# Altium schematic sheet BOARD_ADS.SchDoc
size A3; SheetNumber: 1; SheetTotal: 1
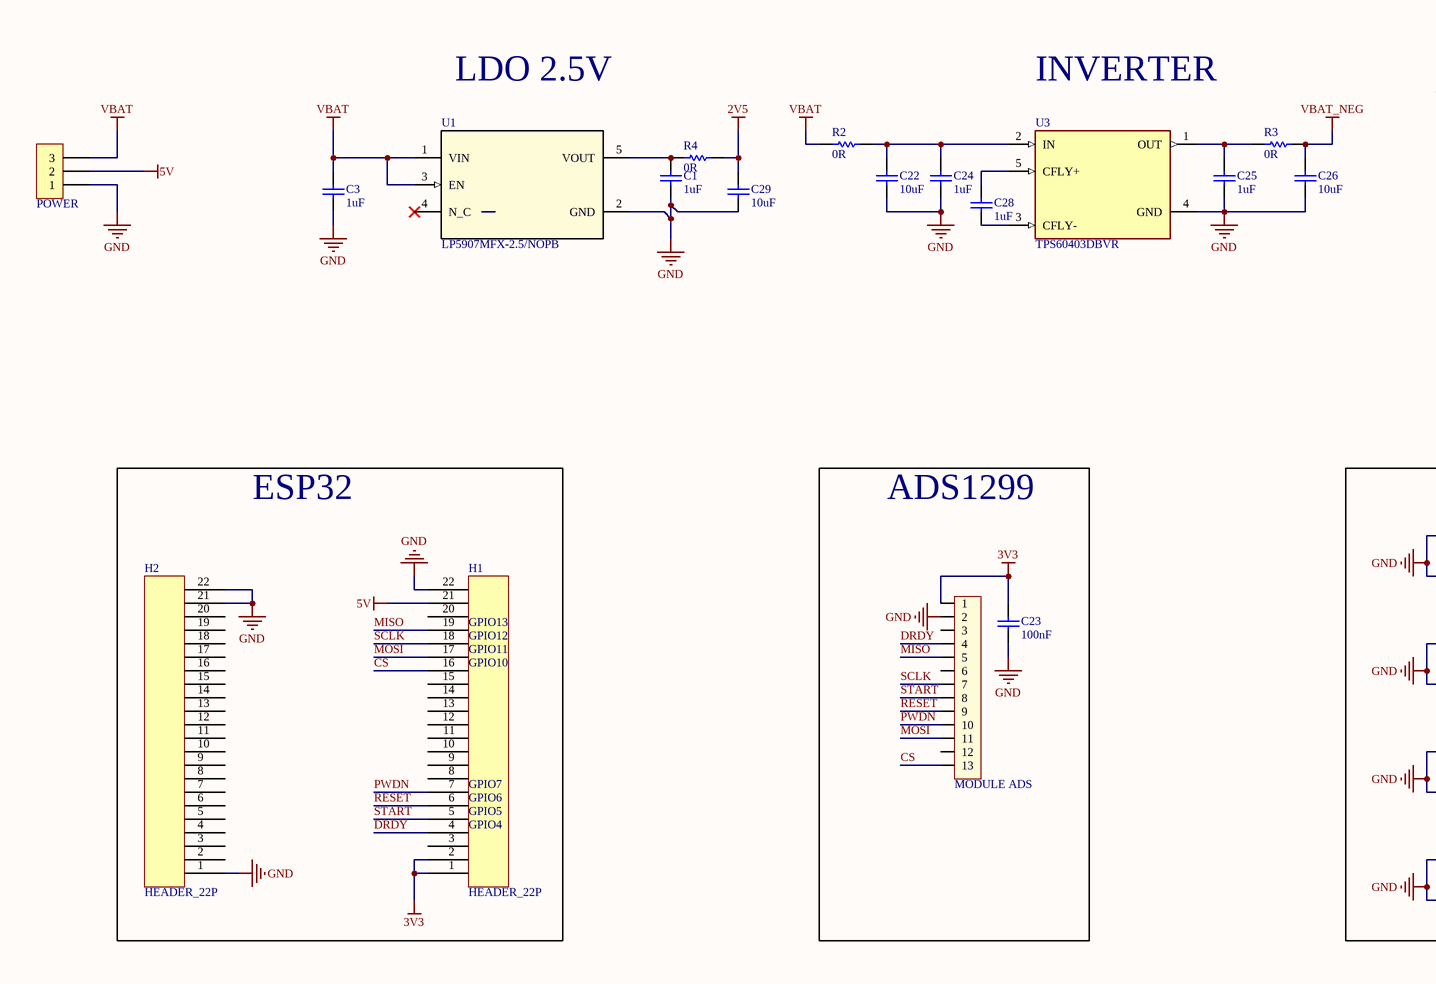
[diagram p0: BOARD_ADS.SchDoc, left]
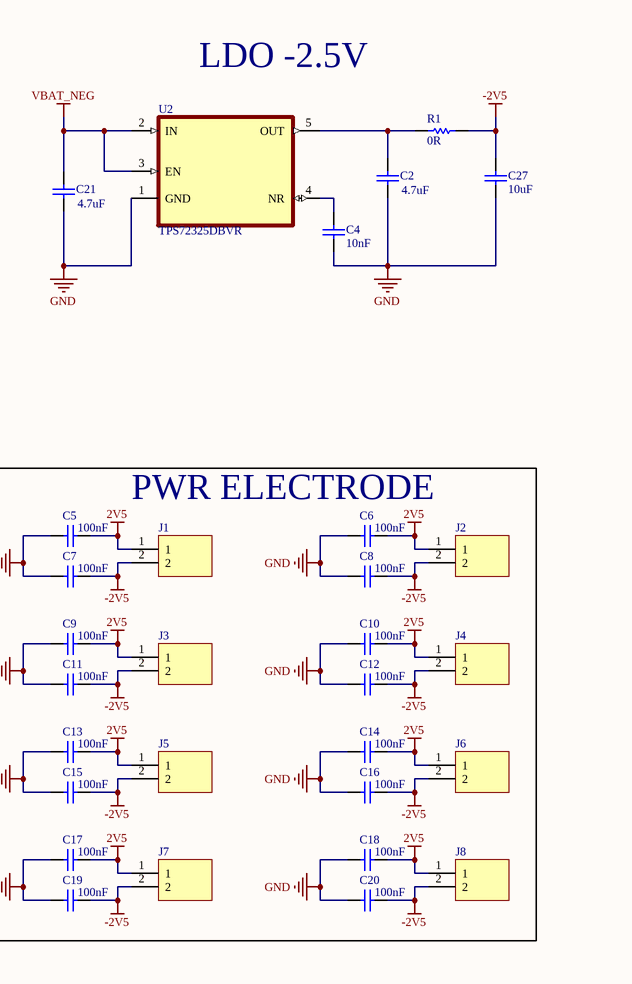
[diagram p1: BOARD_ADS.SchDoc, middle]

## Parts
C1  1uF  [C0805L]
C2  4.7uF  [C0805L]
C3  1uF  [C0805L]
C4  10nF  [C0805L]
C5  100nF  [C0805L]
C6  100nF  [C0805L]
C7  100nF  [C0805L]
C8  100nF  [C0805L]
C9  100nF  [C0805L]
C10  100nF  [C0805L]
C11  100nF  [C0805L]
C12  100nF  [C0805L]
C13  100nF  [C0805L]
C14  100nF  [C0805L]
C15  100nF  [C0805L]
C16  100nF  [C0805L]
C17  100nF  [C0805L]
C18  100nF  [C0805L]
C19  100nF  [C0805L]
C20  100nF  [C0805L]
C21  4.7uF  [C0805L]
C22  10uF  [C0805L]
C23  100nF  [C0805L]
C24  1uF  [C0805L]
C25  1uF  [C0805L]
C26  10uF  [C0805L]
C27  10uF  [C0805L]
C28  1uF  [C0805L]
C29  10uF  [C0805L]
H1  HEADER_22P  [header_22p]
H2  HEADER_22P  [header_22p]
H3  POWER  [XH2.54M-3]
H4  MODULE ADS  [MODULE ADS1299]
J1  (no value)  [HEADER_2P]
J2  (no value)  [HEADER_2P]
J3  (no value)  [HEADER_2P]
J4  (no value)  [HEADER_2P]
J5  (no value)  [HEADER_2P]
J6  (no value)  [HEADER_2P]
J7  (no value)  [HEADER_2P]
J8  (no value)  [HEADER_2P]
R1  0R  [R0805]
R2  0R  [R0805]
R3  0R  [R0805]
R4  0R  [R0805]
U1  LP5907MFX-2.5/NOPB  [DBV0005A_M]
U2  TPS72325DBVR  [SOT95P280X145-5N]
U3  TPS60403DBVR  [SOT95P280X145-5N]

## Blocks framed on the sheet
ESP32: H1 H2
ADS1299: C23 H4
PWR ELECTRODE: C5-C20 J1-J8

## Nets
2V5: C5.2 C6.2 C9.2 C10.2 C13.2 C14.2 C17.2 C18.2 C29.1 J1.1 J2.1 J3.1 J4.1 J5.1 J6.1 J7.1 J8.1 R4.2
3V3: C23.1 H1.1 H1.2 H4.1
5V: H1.21 H3.2
-2V5: C7.2 C8.2 C11.2 C12.2 C15.2 C16.2 C19.2 C20.2 C27.1 J1.2 J2.2 J3.2 J4.2 J5.2 J6.2 J7.2 J8.2 R1.2
GND: C1.2 C2.2 C3.2 C4.2 C5.1 C6.1 C7.1 C8.1 C9.1 C10.1 C11.1 C12.1 C13.1 C14.1 C15.1 C16.1 C17.1 C18.1 C19.1 C20.1 C21.2 C22.2 C23.2 C24.2 C25.2 C26.2 C27.2 C29.2 H1.22 H2.1 H2.21 H2.22 H3.1 H4.2 U1.2(GND) U2.1(GND) U3.4(GND)
VBAT: C3.1 H3.3 R2.1 U1.1(VIN) U1.3(EN)
VBAT_NEG: C21.1 C26.1 R3.2 U2.2(IN) U2.3(EN)
CS: H1.16 H4.13
DRDY: H1.4 H4.4
MISO: H1.19 H4.5
MOSI: H1.17 H4.11
PWDN: H1.7 H4.10
RESET: H1.6 H4.9
SCLK: H1.18 H4.7
START: H1.5 H4.8
NetC1_1: C1.1 R4.1 U1.5(VOUT)
NetC2_1: C2.1 R1.1 U2.5(OUT)
NetC4_1: C4.1 U2.4(NR)
NetC22_1: C22.1 C24.1 R2.2 U3.2(IN)
NetC25_1: C25.1 R3.1 U3.1(OUT)
NetC28_1: C28.1 U3.5(CFLY+)
NetC28_2: C28.2 U3.3(CFLY-)

Not connected (* = marked no-connect by the designer): H1 3 8 9 10 11 12 13 14 15 20; H2 2 3 4 5 6 7 8 9 10 11 12 13 14 15 16 17 18 19 20; H4 3 6 12; U1 4(N_C)*

## Notes on the sheet
- LDO -2.5V
- LDO 2.5V
- INVERTER
- (near H1) GPIO10
- (near H1) GPIO11
- (near H1) GPIO12
- (near H1) GPIO13
- (near H1) GPIO5
- (near H1) GPIO6
- (near H1) GPIO7
- (near H1) GPIO4

## Library data of the parts
C1-C29 = C0805: CAP 0402 MLCC NON-POLARIZED GENERIC; VALUE TOLERANCE VOLTAGE AND MPN SET ON INSTANCE; Type: Capacitor; Value2: SET_VOLTAGE; Case: 0402; Package: 0402
H3 = Header 3P 2.54 Duc Thang: Cắm; Ten_Linh_Kien: Header 3P XH2.54-3P Đực Thẳng; Don_Vi: Con; Ma_Hang: MH001292; Chung_Loai: Cắm
H4 = MODULE_ADS: Cắm; Ten_Linh_Kien: Header 10P XH2.54-10P Đực Cong; Don_Vi: Con; Ma_Hang: MH007094; Chung_Loai: Cắm
J1-J8 = HEADER 2P: HEADER ASSEMBLY, NARROW, MTA-100, 2 POSITION, STRAIGHT | TE Connectivity 3-644456-2; SnapEDA_Link: https://www.snapeda.com/parts/3-644456-2/TE+Connectivity+AMP+Connectors/view-part/?ref=snap; Package: None; Value: *; MF: TE Connectivity; MP: 3-644456-2; Check_prices: https://www.snapeda.com/parts/3-644456-2/TE+Connectivity+AMP+Connectors/view-part/?ref=eda
R1-R4 = R0805: RES 0805 GENERIC; VALUE TOLERANCE POWER AND MPN SET ON INSTANCE; Value1: SET_VALUE; Case: 0805; Type: Resistor; Package: 0805
U1 = LP5907MFX-2.5NOPB: 250-mA, low-noise, high-PSRR, ultra-low-dropout voltage regulator with low IQ and enable 5-SOT-23 -40 to 125; Manufacturer_Name: Texas Instruments; TYPE: TYPE; RefDes: RefDes; Copyright: Copyright (C) 2026 Ultra Librarian. All rights reserved.; Manufacturer_Part_Number: LP5907MFX-2.5/NOPB
U2 = TPS72325DBVR: 200-mA, negative, adjustable low-dropout voltage regulator with enable; MF: Texas Instruments; SnapEDA_Link: https://www.snapeda.com/parts/TPS72325DBVR/Texas+Instruments/view-part/?ref=snap; Package: SOT-23-5 Texas Instruments; Value: *; MP: TPS72325DBVR; Check_prices: https://www.snapeda.com/parts/TPS72325DBVR/Texas+Instruments/view-part/?ref=eda
U3 = TPS60403DBVR: 60mA Charge Pump Voltage Inverter with Fixed 250kHz Operation; MF: Texas Instruments; SnapEDA_Link: https://www.snapeda.com/parts/TPS60403DBVR/Texas+Instruments/view-part/?ref=snap; Package: SOT-23-5 Texas Instruments; Value: *; MP: TPS60403DBVR; Check_prices: https://www.snapeda.com/parts/TPS60403DBVR/Texas+Instruments/view-part/?ref=eda